# Altium schematic sheet TPS2116DRLR.schdoc
size 127 x 101 mm
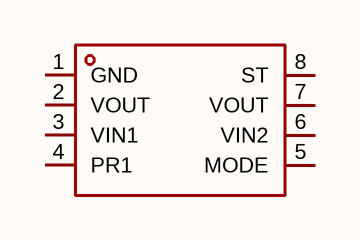
[diagram p0: TPS2116DRLR.schdoc]

## Parts
U?  tps2116drlr  [SOT-583-8_L2.1-W1.6-P0.50-LS1.6-BL]  (value not drawn)

## Nets

Not connected (* = marked no-connect by the designer): U? 1(GND) 2(VOUT) 3(VIN1) 4(PR1) 5(MODE) 6(VIN2) 7(VOUT) 8(ST)

## Library data of the parts
U? = tps2116drlr: TPS2116 1.6V 至 5.5V、40mΩ、2.5A、低 IQ、优先级电源多路复用器; Manufacturer: TI(德州仪器); AddInBom: yes; ModelId: d331d3515dc24cbdb030c9bec303d67a; ModelTransform: 82.677,62.992,0,0,0,0,0,0,0; Symbol: TPS2116DRLR; LCSC Part Name: 具有手动和优先级切换功能的1.6V至5.5V、2.5A低IQ电源多路复用器; SupplierPart: C3235557; ManufacturerPart: TPS2116DRLR; Supplier Footprint: SOT-583; JLCPCB Part Class: Extended Part; Datasheet: https://www.ti.com/cn/lit/gpn/tps2116; Supplier: LCSC; ConvertToPcb: yes; FootprintName: SOT-583-8_L2.1-W1.6-P0.50-LS1.6-BL; ModelName: SOT-583-8_L2.1-W1.6-P0.50-LS1.6-BL; Features: 工作状态指示